# EAGLE design rt_solder_simple_V2.0 (EAGLE 9.6.0)
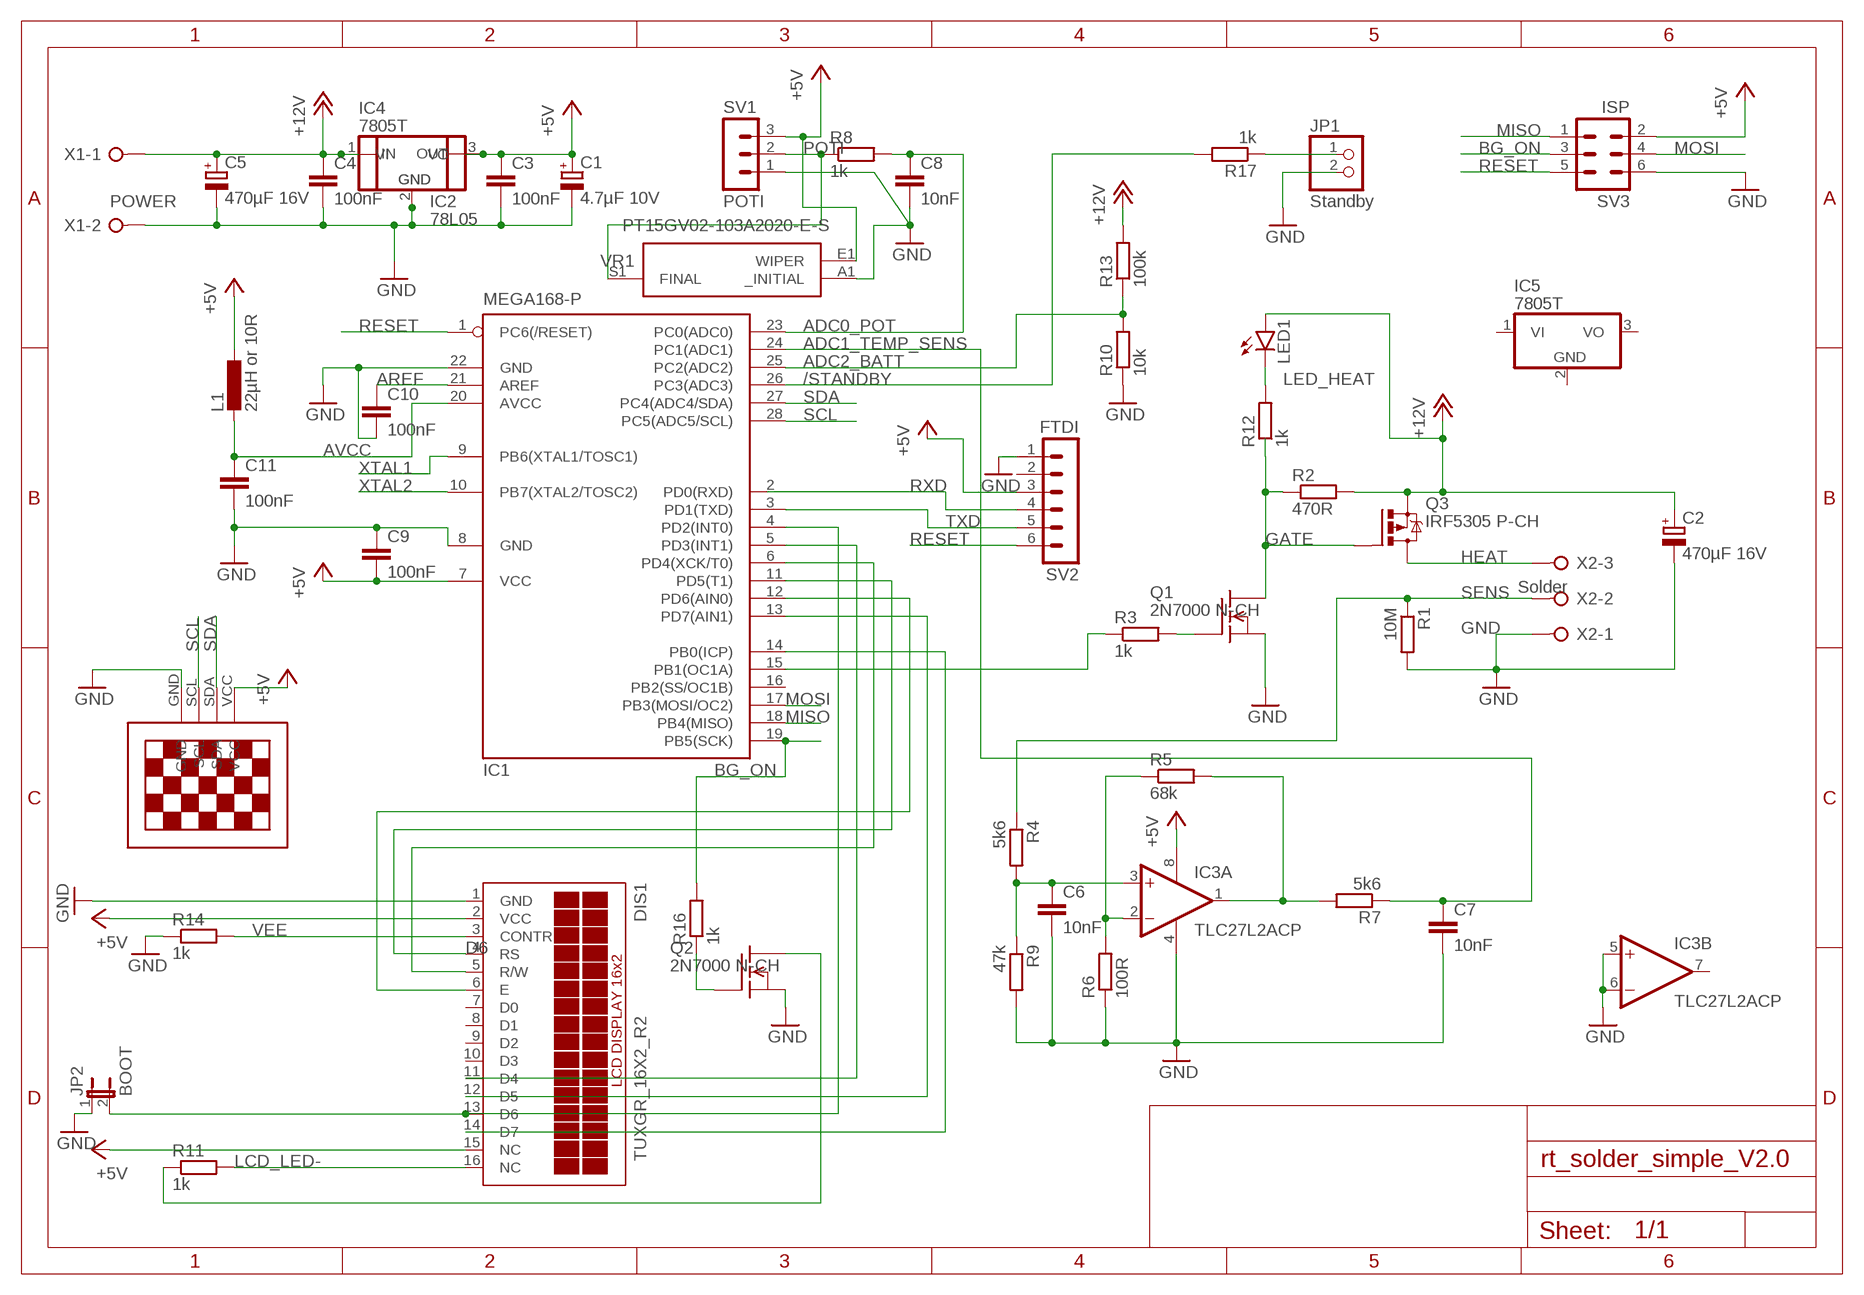
[diagram p0: schematic, sheet 1]

## Parts
C1  4.7µF 10V  CPOL-EUE2.5-6  [E2,5-6]
C2  470µF 16V  CPOL-EUE3.5-10  [E3,5-10]
C3  100nF  C-EU050-035X075  [C050-035X075]
C4  100nF  C-EU050-035X075  [C050-035X075]
C5  470µF 16V  CPOL-EUE3.5-10  [E3,5-10]
C6  10nF  C-EU050-035X075  [C050-035X075]
C7  10nF  C-EU050-035X075  [C050-035X075]
C8  10nF  C-EU050-035X075  [C050-035X075]
C9  100nF  C-EU050-035X075  [C050-035X075]
C10  100nF  C-EU050-035X075  [C050-035X075]
C11  100nF  C-EU050-035X075  [C050-035X075]
DIS1  TUXGR_16X2_R2  [TUXGR_16X2_R2]
IC1  MEGA168-P  MEGA8-P  [DIL28-3]
IC2  78L05  78XXS  [78XXS]
IC3  TLC27L2ACP  [DIL08]
IC4  7805T  [TO220H]
IC5  7805T  [TO220H]
JP1  Standby  PINHD-1X2  [1X02]
JP2  BOOT  JP1E  [JP1]
L1  22µH or 10R  L-EU0207/10  [0207/10]
LED1  LED5MM  [LED5MM]
Q1  2N7000 N-CH  VN2222KM  [TO237]
Q2  2N7000 N-CH  VN2222KM  [TO237]
Q3  IRF5305 P-CH  IRF9530  [TO220BV]
R1  10M  R-EU_0207/10  [0207/10]
R2  470R  R-EU_0207/10  [0207/10]
R3  1k  R-EU_0207/10  [0207/10]
R4  5k6  R-EU_0207/10  [0207/10]
R5  68k  R-EU_0207/10  [0207/10]
R6  100R  R-EU_0207/10  [0207/10]
R7  5k6  R-EU_0207/10  [0207/10]
R8  1k  R-EU_0207/10  [0207/10]
R9  47k  R-EU_0207/10  [0207/10]
R10  10k  R-EU_0207/10  [0207/10]
R11  1k  R-EU_0207/10  [0207/10]
R12  1k  R-EU_0207/10  [0207/10]
R13  100k  R-EU_0207/10  [0207/10]
R14  1k  R-EU_0207/10  [0207/10]
R16  1k  R-EU_0207/10  [0207/10]
R17  1k  R-EU_0207/10  [0207/10]
SV1  POTI  MA03-1  [MA03-1]
SV2  FTDI  MA06-1  [MA06-1]
SV3  ISP  ML6  [ML6]
U$1  13"OLED13"OLED  [1.3"OLED]
VR1  PT15GV02-103A2020-E-S  [PT15GV02103A2020ES]
X1  POWER  W237-02P  [W237-132]
X2  Solder  W237-3E  [W237-3E]

## Nets
+5V [5v]: C1.+ C3.1 C9.2 DIS1.2(VCC) IC1.7(VCC) IC2.OUT IC3.8(C:VDD) IC4.3(VO) L1.1 SV1.3 SV2.3 SV3.2 U$1.VCC VR1.E1(WIPER)
+12V [power]: C2.+ C4.1 C5.+ IC2.IN IC4.1(VI) LED1.A Q3.S R2.2 R13.2 X1.1
/STANDBY: IC1.26(PC3(ADC3)) R17.2
ADC0_POT: C8.1 IC1.23(PC0(ADC0)) R8.2
ADC1_TEMP_SENS: C7.1 IC1.24(PC1(ADC1)) R7.1
ADC2_BATT: IC1.25(PC2(ADC2)) R10.2 R13.1
AREF: C10.1 IC1.21(AREF)
AVCC: C11.1 IC1.20(AVCC) L1.2
BG_ON: IC1.19(PB5(SCK)) R16.2 SV3.3
D4: DIS1.11(D4) IC1.5(PD3(INT1))
D5: DIS1.12(D5) IC1.13(PD7(AIN1))
D6: DIS1.13(D6) IC1.4(PD2(INT0)) JP2.2
D7: DIS1.14(D7) IC1.14(PB0(ICP))
GATE: Q1.1(D) Q3.G R2.1 R12.1
GND: C1.- C2.- C3.2 C4.2 C5.- C6.2 C7.2 C8.2 C9.1 C10.2 C11.2 DIS1.1(GND) IC1.8(GND) IC1.22(GND) IC2.GND IC3.4(C:GND) IC3.5(B:+IN) IC3.6(B:-IN) IC4.2(GND) JP1.2 JP2.1 Q1.3(S) Q2.3(S) R1.2 R6.1 R9.2 R10.1 R14.1 SV1.1 SV2.1 SV3.6 U$1.GND VR1.A1(_INITIAL) X1.2 X2.1
HEAT [power]: Q3.D X2.3
LCD_E: DIS1.6(E) IC1.12(PD6(AIN0))
LCD_LED-: DIS1.16(NC) R11.2
LCD_RS: DIS1.4(RS) IC1.11(PD5(T1))
LCD_RW: DIS1.5(R/W) IC1.6(PD4(XCK/T0))
LED_HEAT: LED1.K(C) R12.2
MISO: IC1.18(PB4(MISO)) SV3.1
MOSI: IC1.17(PB3(MOSI/OC2)) SV3.4
N$1: DIS1.15(NC) ; supply symbol labelled +5V
N$4: Q1.2(G) R3.2
N$5: C6.1 IC3.3(A:+IN) R4.2 R9.1
N$6: IC3.2(A:-IN) R5.1 R6.2
N$8: IC3.1(A:OUT) R5.2 R7.2
N$10: IC1.15(PB1(OC1A)) R3.1
N$13: Q2.2(G) R16.1
N$14: JP1.1 R17.1
N$15: Q2.1(D) R11.1
POTI: R8.1 SV1.2 VR1.S1(FINAL)
RESET: IC1.1(PC6(/RESET)) SV2.6 SV3.5
RXD: IC1.2(PD0(RXD)) SV2.4
SCL: IC1.28(PC5(ADC5/SCL)) U$1.SCL
SDA: IC1.27(PC4(ADC4/SDA)) U$1.SDA
SENS: R1.1 R4.1 X2.2
TXD: IC1.3(PD1(TXD)) SV2.5
VEE: DIS1.3(CONTR) R14.2
XTAL1: IC1.9(PB6(XTAL1/TOSC1))
XTAL2: IC1.10(PB7(XTAL2/TOSC2))
Unconnected: DIS1.7(D0) DIS1.8(D1) DIS1.9(D2) DIS1.10(D3) IC1.16(PB2(SS/OC1B)) IC3.7(B:OUT) IC5.1(VI) IC5.2(GND) IC5.3(VO) SV2.2

## Library data of the parts
C1 C2 C5 = rcl:CPOL-EU: POLARIZED CAPACITOR, European symbol
C3 C4 C6-C11 = rcl:C-EU: CAPACITOR, European symbol
DIS1 = display-lcd:TUXGR_16X2_R2: Tuxgraphics LCD display 16x2 characters reflective, without background light Source: tuxgr_12x2_r2.pdf; OC_FARNELL: unknown; OC_NEWARK: unknown
IC1 = atmel:MEGA8-P: MICROCONTROLLER 8 Kbytes FLASH, 1 kbytes SRAM, 512 bytes EEPROM, USART, 4-channel 10 bit ADC, 2-channel 8 bit ADC Pin compatible with Atmega48, ATMega88, ATMega168 Source: avr.lbr; OC_FARNELL: unknown; OC_NEWARK: unknown
IC2 = v-reg:78XXS: VOLTAGE REGULATOR
IC3 = linear:TLC27L*: LinCMOS(TM) PRECISION DUAL OPERATIONAL AMPLIFIERS Source: http://focus.ti.com/lit/ds/symlink/tlc27l2.pdf
IC4 IC5 = linear:78*: Positive VOLTAGE REGULATOR Source: http://cache.national.com/ds/LM/LM78L05.pdf http://www.fairchildsemi.com/ds/LM/LM7805.pdf
JP1 = pinhead:PINHD-1X2: PIN HEADER
JP2 = jumper:JP1E: JUMPER
L1 = rcl:L-EU: INDUCTOR, European symbol
LED1 = led:LED: LED OSRAM: - CHIPLED LG R971, LG N971, LY N971, LG Q971, LY Q971, LO R971, LY R971 LH N974, LH R974 LS Q976, LO Q976, LY Q976 LO Q996 - Hyper CHIPLED LW Q18S LB Q993, LB Q99A, LB R99A - SideLED LS A670, LO A670, LY A670, LG A670, LP A670 LB A673, LV A673, LT A673, LW A673 LH A674 LY A675 LS A676, LA A676, LO A676, LY A676, LW A676 LS A679, LY A679, LG A679 - Hyper Micro SIDELED® LS Y876, LA Y876, LO Y876, LY Y876 LT Y87S - SmartLED LW L88C, LW L88S LB L89C, LB L89S, LG L890 LS L89K, LO L89K, LY L89K LS L896, LA L896, LO L896, LY L896 - TOPLED LS T670, LO T670, LY T670, LG T670, LP T670 LSG T670, LSP T670, LSY T670, LOP T670, LYG T670 LG T671, LOG T671, LSG T671 LB T673, LV T673, LT T673, LW T673 LH T674 LS T676, LA T676, LO T676, LY T676, LB T676, LH T676, LSB T676, LW T676 LB T67C, LV T67C, LT T67C, LS T67K, LO T67K, LY T67K, LW E67C LS E67B, LA E67B, LO E67B, LY E67B, LB E67C, LV E67C, LT E67C LW T67C LS T679, LY T679, LG T679 LS T770, LO T770, LY T770, LG T770, LP T770 LB T773, LV T773, LT T773, LW T773 LH T774 LS E675, LA E675, LY E675, LS T675 LS T776, LA T776, LO T776, LY T776, LB T776 LHGB T686 LT T68C, LB T68C - Hyper Mini TOPLED® LB M676 - Mini TOPLED Santana® LG M470 LS M47K, LO M47K, LY M47K Source: http://www.osram.convergy.de LUXEON: - LUMILED® LXK2-PW12-R00, LXK2-PW12-S00, LXK2-PW14-U00, LXK2-PW14-V00 LXK2-PM12-R00, LXK2-PM12-S00, LXK2-PM14-U00 LXK2-PE12-Q00, LXK2-PE12-R00, LXK2-PE12-S00, LXK2-PE14-T00, LXK2-PE14-U00 LXK2-PB12-K00, LXK2-PB12-L00, LXK2-PB12-M00, LXK2-PB14-N00, LXK2-PB14-P00, LXK2-PB14-Q00 LXK2-PR12-L00, LXK2-PR12-M00, LXK2-PR14-Q00, LXK2-PR14-R00 LXK2-PD12-Q00, LXK2-PD12-R00, LXK2-PD12-S00 LXK2-PH12-R00, LXK2-PH12-S00 LXK2-PL12-P00, LXK2-PL12-Q00, LXK2-PL12-R00 Source: www.luxeon.com KINGBRIGHT: KA-3528ASYC Source: www.kingbright.com
Q1 Q2 = transistor-fet:VN2222KM: N-Channel Enhancement MOSFET (VMOS); 60V; 0,5A; 7,5Ohm
Q3 = transistor-power:IRF9530: P-CHANNEL HEXFET POWER-MOS-FET Source: http://www.irf.com/product-info/datasheets/data/irf9530.pdf
R1-R14 R16 R17 = rcl:R-EU_: RESISTOR, European symbol
SV1 = con-lstb:MA03-1: PIN HEADER; OC_FARNELL: unknown; OC_NEWARK: unknown
SV2 = con-lstb:MA06-1: PIN HEADER; OC_FARNELL: unknown; OC_NEWARK: unknown
SV3 = con-harting-ml:ML6: HARTING; OC_FARNELL: unknown; OC_NEWARK: unknown
U$1 = 13oled:13"OLED
VR1 = SamacSys_Parts:PT15GV02-103A2020-E-S: Trimmer Resistors - Through Hole 15mm control/sensor trimmr potentiometer Source: Datasheet <https://www.piher.net/pdf/15-PTC15v03.pdf>; DESCRIPTION: Trimmer Resistors - Through Hole 15mm control/sensor trimmr potentiometer; HEIGHT: 7.2mm; MANUFACTURER_NAME: PIHER; MANUFACTURER_PART_NUMBER: PT15GV02-103A2020-E-S; MOUSER_PART_NUMBER: 531-PT15GV02103A22ES; MOUSER_PRICE-STOCK: https://www.mouser.co.uk/ProductDetail/Amphenol-Piher/PT15GV02-103A2020-E-S?qs=DPoM0jnrROVsaSbOUHWyTQ%3D%3D
X1 = con-wago-508:W237-02P: WAGO SREW CLAMP; OC_FARNELL: unknown; OC_NEWARK: unknown
X2 = con-wago-508:W237-3E: WAGO SREW CLAMP; OC_FARNELL: unknown; OC_NEWARK: unknown

## Net classes
0 default: width 0.3 mm
1 power: width 1 mm
2 5v: width 0.5 mm

## Board
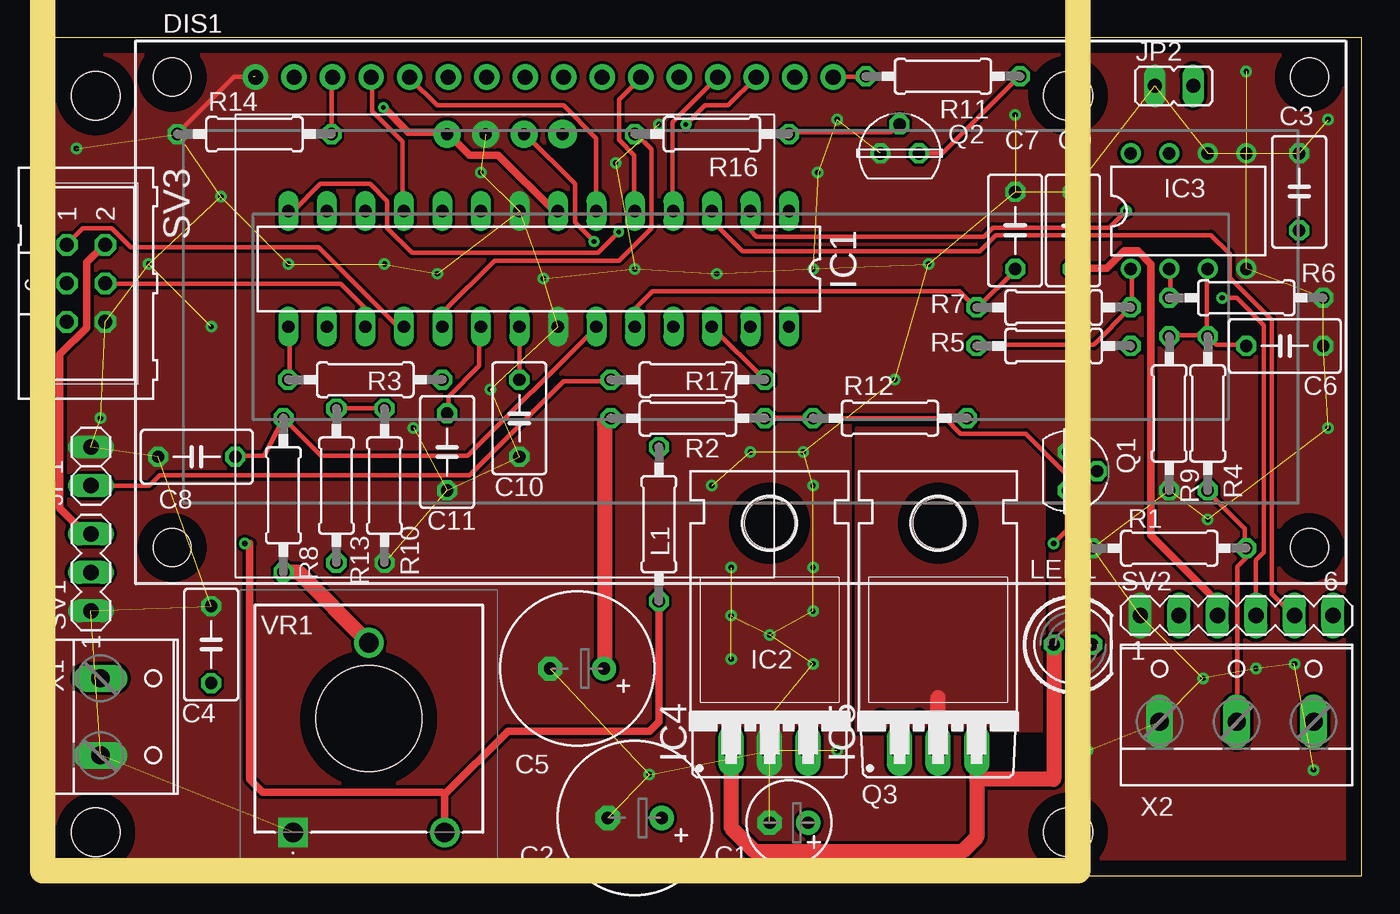
[diagram p1: board, top side]
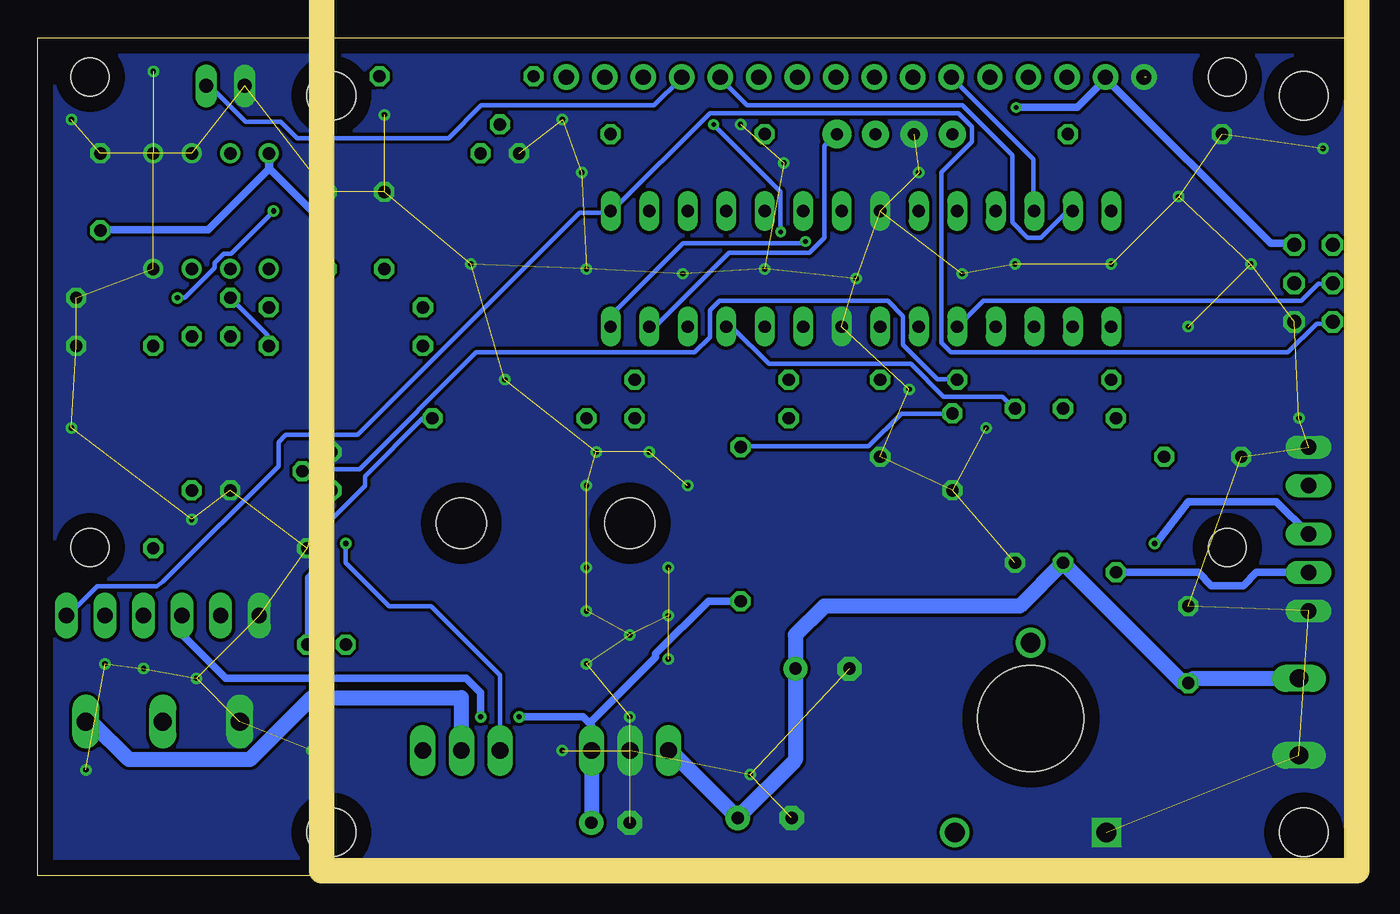
[diagram p2: board, bottom side, seen from below]

Size 87.3 x 55.23 mm. Coordinates in mm from the lower left corner, seen from the top.
Outline: 0,0 87.3,0 87.3,55.23 0,55.23 0,0
Copper layers (1*16): Top 0.035mm / dielectric 1.5mm / Bottom 0.035mm
Design rules "PCBway": minimum track width 6mil, minimum drill 0.3mm, track to track 0.205mm, track to pad 0.205mm, pad to pad 0.205mm, via to via 0.205mm, smd to smd 8mil, copper to edge 40mil, drill to drill 8mil, minimum pad ring 10mil, minimum via ring 8mil, stop-mask expansion 4mil, vias tented up to drill 25mil, thermal gap 10mil
Holes 3.2 mm at 3.81,51.44 3.81,2.86 67.94,2.86 67.94,51.44
Milling: 4 lines

### Footprints (pad centres in the part's own frame; a part is rotated, then mirrored left to right if it is on the bottom)
E2,5-6 = drill 0.813 pad 1.6: + -1.27,0 | drill 0.813 pad 1.6 octagon: - 1.27,0
E3,5-10 = drill 0.813 pad 1.6: + -1.778,0 | drill 0.813 pad 1.6 octagon: - 1.778,0
C050-035X075 = drill 0.813 octagon: 1 -2.54,0; 2 2.54,0
TUXGR_16X2_R2 = drill 1 pad 1.676: 1 -32,15.5; 2 -29.46,15.5; 3 -26.92,15.5; 4 -24.38,15.5; 5 -21.84,15.5; 6 -19.3,15.5; 7 -16.76,15.5; 8 -14.22,15.5; 9 -11.68,15.5; 10 -9.14,15.5; 11 -6.6,15.5; 12 -4.06,15.5; 13 -1.52,15.5; 14 1.02,15.5; 15 3.56,15.5; 16 6.1,15.5 | hole 2.5: -37.5,-15.5; 37.5,-15.5; -37.5,15.5; 37.5,15.5
DIL28-3 = drill 0.813 long: 1 -16.51,-3.81; 2 -13.97,-3.81; 3 -11.43,-3.81; 4 -8.89,-3.81; 5 -6.35,-3.81; 6 -3.81,-3.81; 7 -1.27,-3.81; 8 1.27,-3.81; 9 3.81,-3.81; 10 6.35,-3.81; 11 8.89,-3.81; 12 11.43,-3.81; 13 13.97,-3.81; 14 16.51,-3.81; 15 16.51,3.81; 16 13.97,3.81; 17 11.43,3.81; 18 8.89,3.81; 19 6.35,3.81; 20 3.81,3.81; 21 1.27,3.81; 22 -1.27,3.81; 23 -3.81,3.81; 24 -6.35,3.81; 25 -8.89,3.81; 26 -11.43,3.81; 27 -13.97,3.81; 28 -16.51,3.81
78XXS = drill 1.016 long: GND 0,-2.54; IN -2.54,-2.54; OUT 2.54,-2.54
DIL08 = drill 0.813 pad 1.27: 1 -3.81,-3.81; 2 -1.27,-3.81; 3 1.27,-3.81; 4 3.81,-3.81; 5 3.81,3.81; 6 1.27,3.81; 7 -1.27,3.81; 8 -3.81,3.81
TO220H = drill 1.118 long: 1 -2.54,-10.16; 2 0,-10.16; 3 2.54,-10.16 | hole 3.302: 0,4.826
1X02 = drill 1.016 long: 1 -1.27,0; 2 1.27,0
JP1 = drill 0.914 long: 1 0,-1.27; 2 0,1.27
0207/10 = drill 0.813 octagon: 1 -5.08,0; 2 5.08,0
LED5MM = drill 0.813 octagon: A -1.27,0; K 1.27,0
TO237 = drill 0.813 octagon: 1 1.27,0; 2 0,1.905; 3 -1.27,0
TO220BV = drill 1.016 long: D 0,-2.54; G -2.54,-2.54; S 2.54,-2.54
MA03-1 = drill 1.016 long: 1 -2.54,0; 2 0,0; 3 2.54,0
MA06-1 = drill 1.016 long: 1 -6.35,0; 2 -3.81,0; 3 -1.27,0; 4 1.27,0; 5 3.81,0; 6 6.35,0
ML6 = drill 0.914 octagon: 1 -2.54,-1.27; 2 -2.54,1.27; 3 0,-1.27; 4 0,1.27; 5 2.54,-1.27; 6 2.54,1.27
1.3"OLED = drill 0.8 pad 1.778: GND 2.54,0; SCL 5.08,0; VCC 0,0 | drill 0.8 pad 1.9: SDA 7.62,0
PT15GV02103A2020ES = drill 1.3 pad 1.95 square: A1 0,0 | drill 1.3 pad 1.95: E1 10,0; S1 5,12.5 | hole 7: 5,7.5
W237-132 = drill 1.194 long: 1 -2.54,-0.635; 2 2.54,-0.635
W237-3E = drill 1.194 long: 1 -5.08,-0.635; 2 0,-0.635; 3 5.08,-0.635

### Placement (x,y rotation side)
C1  49.53,3.49 180 top
C2  39.37,3.81 180 top
C3  83.19,45.09 90 top
C4  11.43,15.24 90 top
C5  35.56,13.65 180 top
C6  82.23,34.93 0 top
C7  64.45,42.55 90 top
C8  10.48,27.62 180 top
C9  68.26,42.55 270 top
C10  31.75,30.16 270 top
C11  26.99,27.94 270 top
DIS1  46.36,37.15 0 top
IC1  33.02,40.01 180 top
IC2  48.26,10.79 0 top
IC3  75.88,43.82 0 top
IC4  48.26,18.41 0 top
IC5  59.37,18.41 0 top
JP1  3.49,26.99 90 top
JP2  74.93,52.07 270 top
L1  40.96,23.18 90 top
LED1  68.26,15.24 0 top
Q1  67.94,26.67 270 top
Q2  56.83,47.62 0 top
Q3  59.37,10.79 0 top
R1  74.61,21.59 180 top
R2  42.86,30.16 180 top
R3  21.59,32.7 0 top
R4  77.15,30.48 90 top
R5  66.99,34.93 180 top
R6  79.69,38.1 180 top
R7  66.99,37.47 0 top
R8  16.19,25.08 90 top
R9  74.61,30.48 270 top
R10  22.86,25.72 90 top
R11  59.69,52.71 180 top
R12  56.2,30.16 0 top
R13  19.68,25.72 270 top
R14  14.29,48.9 0 top
R16  44.45,48.9 180 top
R17  42.86,32.7 0 top
SV1  3.49,20 90 top
SV2  79.06,17.14 0 top
SV3  3.17,39.05 270 top
U$1  26.99,48.9 0 top
VR1  16.83,2.86 0 top
X1  4.76,10.48 270 top
X2  79.06,10.79 0 top

### Tracks (layer width: path | path; a pad name or v marks a point on that pad's centre or on a via)
+5V  (via drill 0.3, 0.35)
  Top 0.5: IC1.7 34.28,43.84 34.03,43.84 30.36,47.5 28.47,47.5 27.08,48.89 U$1.VCC 26.83,49.01 24.43,49.01 v22.79,50.66 | SV1.3 3.38,22.29 1.45,24.22 1.45,34.37 3.22,36.14 3.22,40.43 4.36,41.57 SV3.2 | SV2.3 77.79,18.07 73.42,22.45 73.42,40.3 72.53,41.19 71.65,41.19 70.51,40.05 68.37,40.05 C9.2 | v58.1,10.48 v55.56,10.48 | VR1.E1 26.83,5.35 | 26.83,5.35 26.67,5.51 14.82,5.51 13.97,6.36 13.97,21.91 v13.65,21.91 | 26.83,5.35 31,9.52 40.32,9.52 40.96,10.16 L1.1 | IC4.3 50.82,8.24 IC4.3
  Bottom 0.5: SV1.3 5.62,24.67 11.43,24.67 13.57,21.88 13.62,21.88 v13.65,21.91 | SV3.2 4.48,41.69 6,41.69 16.9,52.59 DIS1.2 16.9,52.51 18.75,50.66 v22.79,50.66 | C9.2 68.37,40.05 68.37,42.95 72.03,46.61 72.03,47.5 IC3.8 72.07,46.57 76.06,42.58 83.14,42.58 C3.1 | v55.56,10.48 51.35,10.48 50.8,9.93 IC4.3 50.82,8.61 50.82,10.14 46.55,14.41 46.55,14.63 43.09,18.1 L1.1 | v58.1,10.48 58.1,12.07 59.05,13.02 74.92,13.02 77.79,15.88 SV2.3
  Bottom 1: IC4.3 C1.+
+12V
  Top 1: IC4.1 45.72,3.17 47.31,1.59 60.96,1.59 61.91,2.54 Q3.S 61.91,6.35 66.99,6.35 LED1.A | R2.2 37.37,29.79 37.37,13.68 C5.+
  Bottom 1: X1.1 11.11,13.02 C4.1 11.75,12.7 R13.2 22.54,17.78 35.43,17.78 37.34,15.87 C5.+ 37.34,7.62 C2.+ 45.59,8.26 IC4.1
/STANDBY
  Top 0.3: IC1.26 44.51,36.14 47.91,32.73 R17.2
ADC0_POT
  Top 0.3: C8.1 13.07,27.68 14.92,27.68 R8.2 18.68,27.68 28.34,27.68 36.8,36.14 IC1.23
ADC1_TEMP_SENS
  Top 0.3: IC1.24 39.37,37.39 40.52,38.54 60.79,38.54 61.8,37.53 R7.1 61.93,37.4 64.45,39.93 C7.1
ADC2_BATT
  Top 0.3: R13.1 19.76,30.83 22.79,30.83 R10.2
  Bottom 0.3: IC1.25 41.85,36.14 41.47,36.14 39.08,33.74 29.73,33.74 27.59,31.59 23.67,31.59 22.92,30.83 R10.2
AREF
  Top 0.3: C10.1 31.75,32.73 31.75,36.14 IC1.21
AVCC
  Top 0.3: C11.1 27.08,30.58 27.08,31.59 29.1,33.61 29.1,36.14 IC1.20
  Bottom 0.3: L1.2 40.84,28.31 32.51,28.31 30.36,30.46 27.08,30.46 C11.1
BG_ON
  Top 0.3: IC1.19 26.67,37.12 30.11,40.56 38.32,40.56 40.47,42.7 40.47,47.88 39.46,48.89 R16.2
  Bottom 0.3: SV3.3 1.96,39.04 2.84,39.04 3.98,37.9 24.94,37.9 26.58,36.26 IC1.19
D4
  Top 0.3: IC1.5 39.33,43.84 39.33,47.5 38.32,48.51 38.32,51.16 39.83,52.68 39.78,52.68 DIS1.11
D5
  Bottom 0.3: DIS1.12 42.29,52.55 40.53,50.78 26.33,50.78 23.04,47.5 23.04,43.08 22.03,42.07 21.15,42.07 19.51,43.71 19.13,43.71 IC1.13
D6
  Top 0.3: IC1.4 41.85,43.84 41.85,49.67 DIS1.13
  Bottom 0.3: JP2.2 76.19,52.04 75.94,52.04 73.61,49.72 71.29,49.72 70.21,48.64 60.23,48.64 58.08,50.78 46.65,50.78 44.88,52.55 44.88,52.6 DIS1.13
D7  (via drill 0.3)
  Top 0.3: v38.32,42.45 36.93,41.06 24.68,41.06 23.04,42.7 23.04,44.47 21.91,45.61 18.62,45.61 16.86,43.84 16.6,43.84 IC1.14 | v42.74,49.52 44,50.78 45.51,50.78 DIS1.14
  Bottom 0.3: v38.32,42.45 38.32,45.1 v42.74,49.52
GATE  (via drill 0.35)
  Top 0.3: R2.1 48.04,30.2 51.07,30.2 R12.1 59.84,30.16 60.86,29.15 65.15,29.15 67.94,26.35 Q1.1 67.86,25.41 67.86,22.78 v66.99,21.91
  Bottom 0.3: Q3.G 56.83,13.23 61.38,17.78 64.14,17.78 66.99,20.64 v66.99,21.91
GND  (via drill 0.35)  (78 unrouted)
  Top 0.3: 14.33,52.68 DIS1.1 | 14.2,52.68 12.94,52.68 9.28,49.01 R14.1
  other vias: 84.14,6.99 48.26,10.48 45.72,17.14 51.12,17.46 50.48,27.94 44.45,25.72 64.45,50.16 52.71,49.85 79.69,53.02 85.09,49.85 85.09,29.53 11.43,36.2 7.3,40.32 12.07,44.77 2.54,47.94 4.13,30.16 22.86,40.32 16.51,40.32 33.34,39.37 26.35,39.69 29.21,46.36 51.44,46.36 58.74,40.32 51.12,40.01 44.77,39.69 39.37,40.01 76.83,13.02 69.21,8.26 52.71,8.26 40.32,6.67 82.87,13.97 77.15,23.49 80.33,13.65 45.72,14.29 51.12,13.97 51.12,20.32 45.72,20.32 51.12,25.72 48.26,15.88 56.52,32.7 46.99,27.94 24.77,29.53 29.84,32.07 38.1,46.99 40.96,49.53
  pour Bottom (rank 6, no thermals): -0.31,62.55 88.27,62.55 88.27,-0.32 -1.02,-0.73
  pour Top (rank 6, no thermals): -0.31,62.55 88.27,62.55 88.27,-0.63 -1.03,-1.05
HEAT
  Top 1: Q3.D 59.37,11.75
  Bottom 1: X2.3 83.8,10.16 81.31,7.66 73.31,7.66 69.23,11.75 59.37,11.75 Q3.D
  pour Top (no thermals): 53.98,9.53 53.98,29.53 66.36,29.53 66.36,9.53
LCD_E
  Bottom 0.3: 26.96,52.55 21.65,47.25 21.65,43.84 IC1.12
  Bottom 0.5: DIS1.6 26.96,52.55
LCD_LED-
  Top 0.3: R11.2 54.61,52.68 52.46,52.68 DIS1.16
LCD_RS
  Top 0.3: IC1.11 24.05,43.84 24.05,48.38 22.03,50.4 22.03,52.59 DIS1.4
LCD_RW
  Top 0.3: IC1.6 36.8,43.84 36.8,48.64 34.66,50.78 26.33,50.78 24.56,52.55 DIS1.5
LED_HEAT
  Bottom 0.3: LED1.K 69.5,15.31 69.53,15.34 69.53,19.68 68.26,20.95 68.26,23.18 65.72,25.72 65.72,26.35 61.91,30.16 R12.2
MISO
  Top 0.3: IC1.18 24.05,36.26 23.67,36.26 18.5,41.44 6.13,41.44 4.86,42.7 2.97,42.7 1.96,41.69 SV3.1
MOSI
  Top 0.3: IC1.17 21.59,37.41 19.96,39.04 4.48,39.04 SV3.4
N$4
  Bottom 0.3: Q1.2 69.76,26.79 66.09,26.79 58.39,34.5 44,34.5 42.99,35.51 42.99,37.27 42.36,37.9 31.25,37.9 30.24,36.9 30.24,35 27.97,32.73 26.7,32.73 R3.2
N$5
  Top 0.3: C6.1 79.6,35 77.71,35 77.2,35.51 R4.2 | R9.1 74.68,35.63 77.08,35.63 R4.2 | IC3.3 77.08,39.93 77.08,35.76 R4.2
N$6
  Top 0.3: IC3.2 74.68,39.93 74.68,38.16 R6.2
  Bottom 0.3: R5.1 72.15,35 72.15,35.63 74.55,38.03 R6.2
N$8
  Top 0.3: R5.2 61.93,35 69.63,35 72.03,37.4 R7.2 72.15,37.53 72.15,39.93 IC3.1
N$10
  Top 0.3: R3.1 16.6,32.73 16.6,36.14 IC1.15
N$13
  Top 0.3: R16.1 49.55,49.01 56.25,49.01 56.75,49.52 Q2.2
N$14
  Top 0.3: R17.1 37.69,32.6 34.66,32.6 28.47,26.42 8.02,26.42 7.32,25.72 JP1.1
N$15
  Top 0.3: Q2.1 58.14,47.63 59.65,47.63 64.71,52.68 R11.1
POTI
  Top 1: VR1.S1 17.18,20 R8.1
  Bottom 0.5: SV1.2 6.94,20 7.81,19.13 9.9,19.13 10.77,20 R8.1
RESET
  Bottom 0.3: SV2.6 85.28,17.2 83.39,19.09 79.48,19.09 79.06,19.37 71.44,26.99 71.44,28.58 70.94,29.07 66.22,29.07 51.58,43.71 49.55,43.71 IC1.1 49.43,43.84 42.99,50.28 26.58,50.28 25.69,49.39 25.69,48.38 27.71,46.36 27.71,35.13 27.08,34.5 4.86,34.5 2.97,36.39 1.96,36.39 SV3.5
RXD  (via drill 0.35)
  Top 0.3: SV2.4 80.33,20.79 80.86,21.33 80.86,36.29 79.06,38.1 v78.1,38.1 | IC1.2 46.99,42.54 47.4,42.14 62.38,42.14 62.97,42.73 70.67,42.73 v71.76,43.82
  Bottom 0.3: v71.76,43.82 74.55,41.02 75.03,41.02 75.63,40.43 75.63,40.09 77.62,38.1 v78.1,38.1
SCL  (via drill 0.3)
  Top 0.3: v36.68,41.82 35.41,43.08 35.41,45.61 32.13,48.89 U$1.SCL
  Bottom 0.3: v36.68,41.82 36.8,41.69 44.76,41.69 49.43,37.02 49.43,36.26 IC1.28
SDA
  Bottom 0.3: IC1.27 46.9,36.26 46.53,36.26 41.73,41.06 36.43,41.06 35.41,42.07 35.41,48.13 34.66,48.89 U$1.SDA
SENS
  Top 0.3: R4.1 77.2,25.28 79.6,22.88 79.6,21.59 R1.1 79.69,20.98 79.1,20.36 79.1,10.26 X2.2
TXD
  Top 0.3: IC1.3 44.45,43.19 46.46,41.18 62.14,41.18 63.18,42.23 77.37,42.23 78.59,41 78.59,39.43 81.37,36.65 81.37,18.59 82.76,17.2 SV2.5
VEE
  Top 0.3: R14.2 19.38,49.01 19.38,52.55 19.43,52.6 DIS1.3

### Text on the board
tValues: 5V | GND | 12V | GND | GND | HEAT | SENS
Document: 14 | 1 | RXD | TXD